# Altium project CH32V003J4M6_kit.PrjPCB
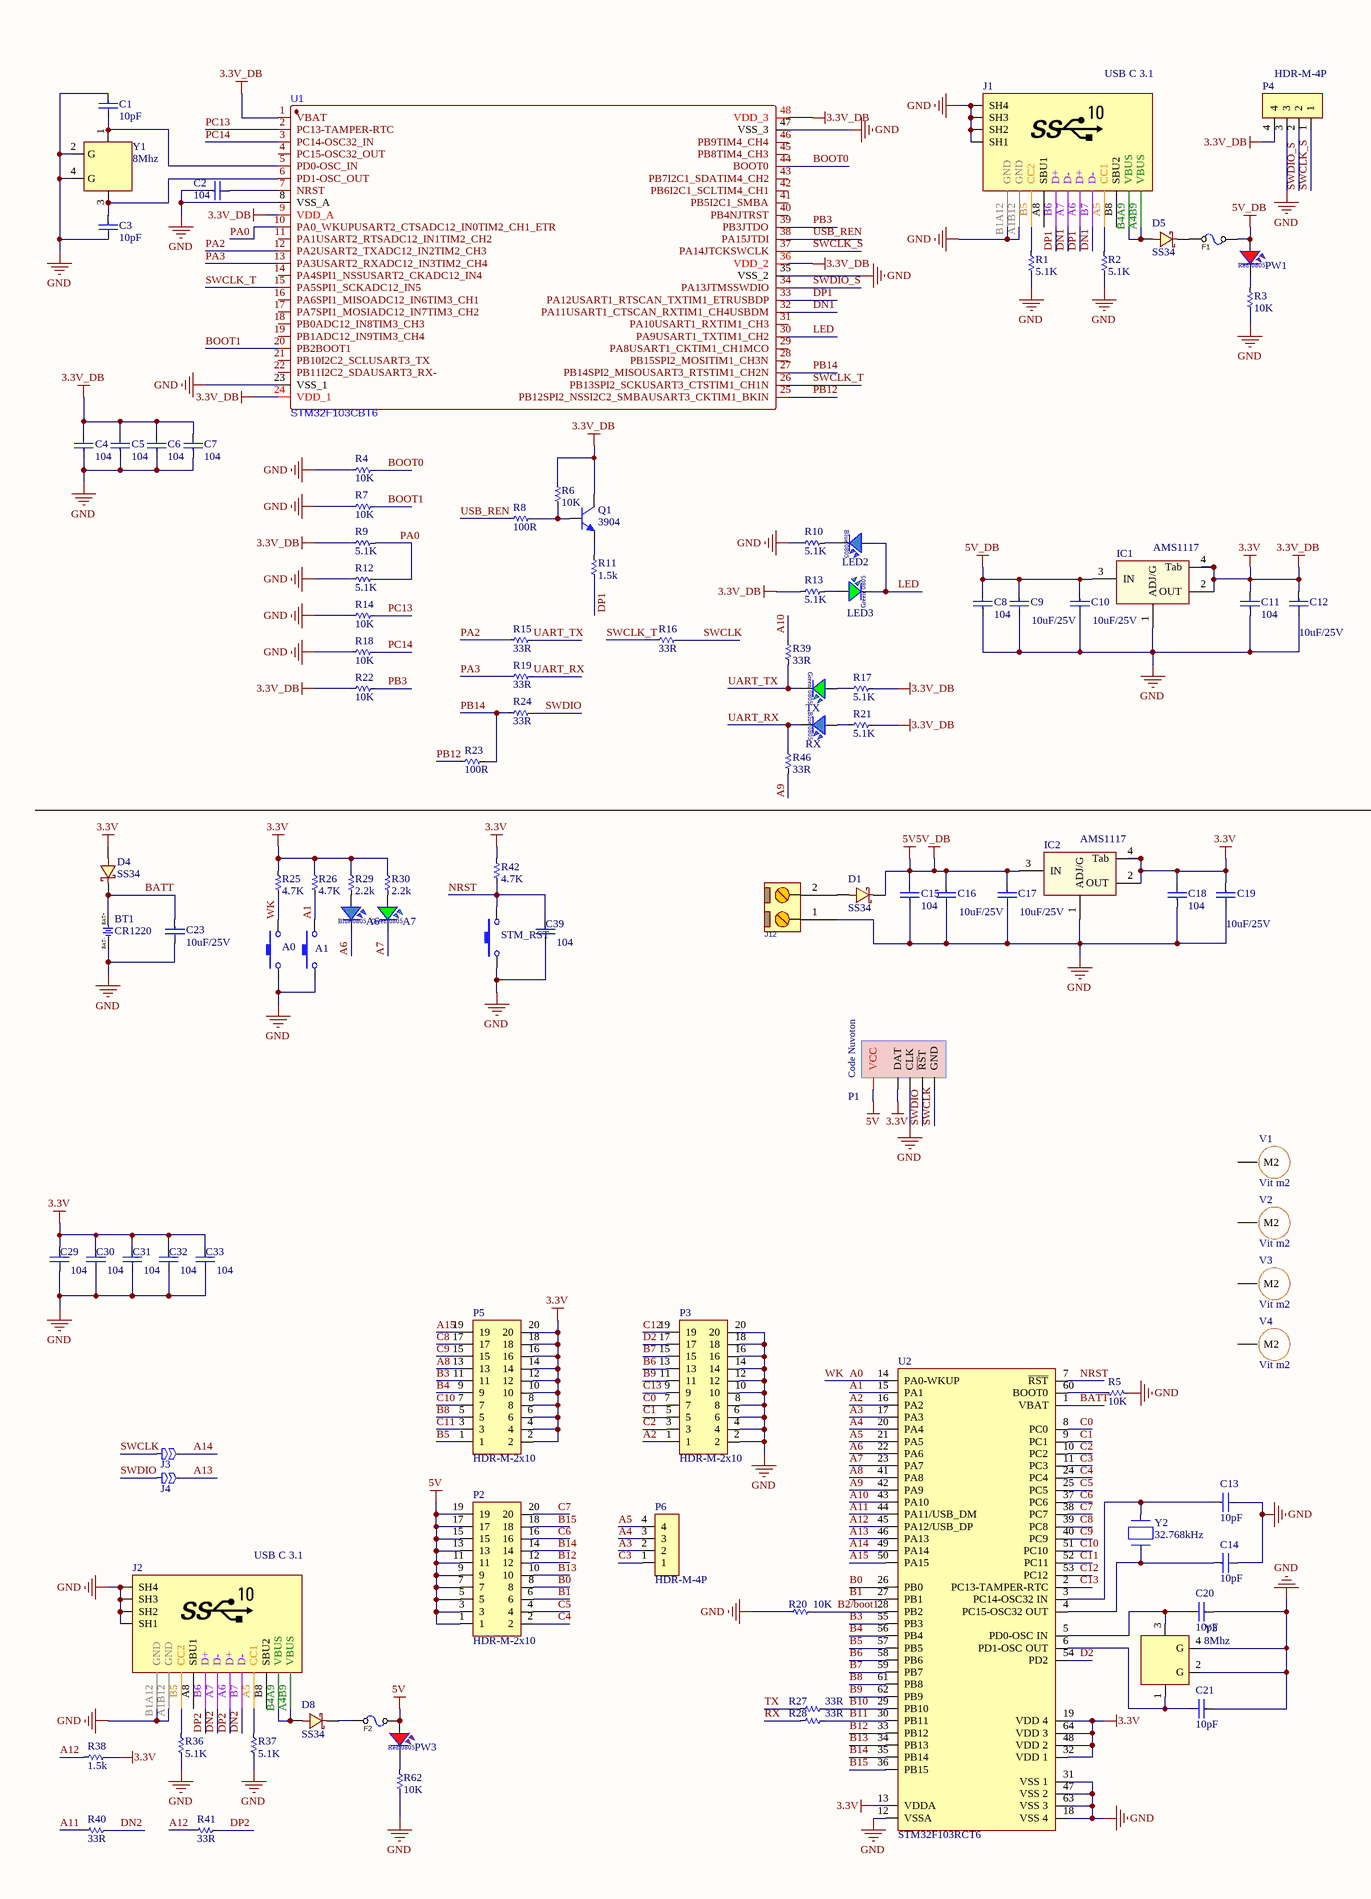
[diagram p0: CH32V003J4M6.SchDoc, left]
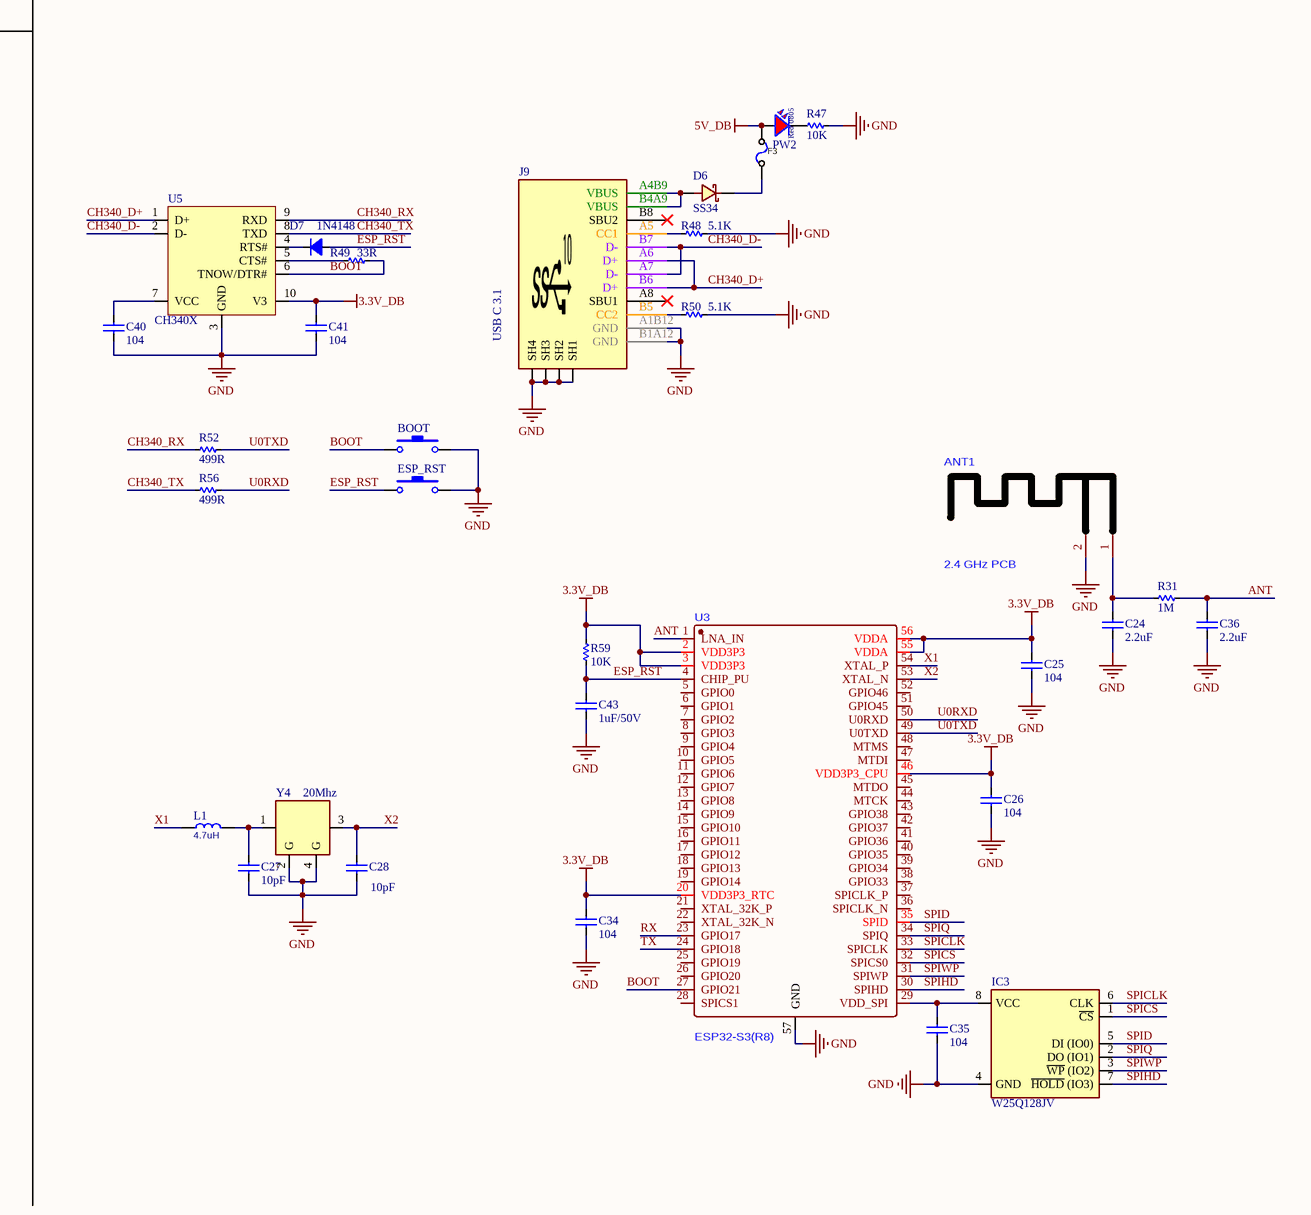
[diagram p1: CH32V003J4M6.SchDoc, right]
1 sheet, 140 parts. Net scope: global (net labels, ports and power ports of the same name join across sheets).
Board file: pcb.PcbDoc

## Sheet CH32V003J4M6.SchDoc: <Project Name>
size A2; ENG_APP_DATE: --/--/--; DSN_APP_DATE: --/--/--; CHK_APP_DATE: --/--/--; Engineer: Engineer; Address4: Thành phố Hồ Chí Minh; DocumentNumber: 1; Revision: 1.0; SheetNumber: 1; SheetTotal: 1

### Parts
A0  SW-SMD  [SW-SMD 3x6 mm]  (value not drawn)
A1  SW-SMD  [SW-SMD 3x6 mm]  (value not drawn)
A6  LED BLUE  [LED 0805 Blue]  (value not drawn)
A7  LED GREEN  [LED 0805 Green]  (value not drawn)
ANT1  2.4 GHz PCB  [2.4 GHZ PCB ANTENA]
BOOT  SW-SMD  [SW-SMD 3x6 mm]  (value not drawn)
BT1  CR1220  [BTH1220]  (no BOM)
C1  10pF  [C_0805_SMD]
C2  104  [C_0805_SMD]
C3  10pF  [C_0805_SMD]
C4  104  [C_0805_SMD]
C5  104  [C_0805_SMD]
C6  104  [C_0805_SMD]
C7  104  [C_0805_SMD]
C8  104  [C_0805_SMD]
C9  10uF/25V  [C_0805_SMD]
C10  10uF/25V  [C_0805_SMD]
C11  104  [C_0805_SMD]
C12  10uF/25V  [C_0805_SMD]
C13  10pF  [C_0805_SMD]
C14  10pF  [C_0805_SMD]
C15  104  [C_0805_SMD]
C16  10uF/25V  [C_0805_SMD]
C17  10uF/25V  [C_0805_SMD]
C18  104  [C_0805_SMD]
C19  10uF/25V  [C_0805_SMD]
C20  10pF  [C_0805_SMD]
C21  10pF  [C_0805_SMD]
C23  10uF/25V  [C_0805_SMD]
C24  2.2uF  [C_0603_SMD]
C25  104  [C_0805_SMD]
C26  104  [C_0805_SMD]
C27  10pF  [C_0805_SMD]
C28  10pF  [C_0805_SMD]
C29  104  [C_0805_SMD]
C30  104  [C_0805_SMD]
C31  104  [C_0805_SMD]
C32  104  [C_0805_SMD]
C33  104  [C_0805_SMD]
C34  104  [C_0805_SMD]
C35  104  [C_0805_SMD]
C36  2.2uF  [C_0603_SMD]
C39  104  [C_0805_SMD]
C40  104  [C_0805_SMD]
C41  104  [C_0805_SMD]
C43  1uF/50V  [C_0805_SMD]
D1  SS34  [D_SMA]
D4  SS34  [D_SMA]
D5  SS34  [D_SMA]
D6  SS34  [D_SMA]
D7  1N4148  [D_SOD323]
D8  SS34  [D_SMA]
ESP_RST  SW-SMD  [SW-SMD 3x6 mm]  (value not drawn)
F1  0805L050WR  [F0805]  (value not drawn)
F2  0805L050WR  [F0805]  (value not drawn)
F3  0805L050WR  [F0805]  (value not drawn)
IC1  AMS1117  [SOT223-4N]
IC2  AMS1117  [SOT223-4N]
IC3  W25Q128JV  [SO_8_W]
J1  USB C 3.1  [USBC_SMD_16_USB4105]
J2  USB C 3.1  [USBC_SMD_16_USB4105]
J3  Jump  [JP_0603]  (value not drawn)  (no BOM)
J4  Jump  [JP_0603]  (value not drawn)  (no BOM)
J9  USB C 3.1  [USBC_SMD_16_USB4105]
J12  KF3.81-2P  [CONN KF-3.81-2-R]  (value not drawn)
L1  4.7uH  [L 0805]
LED2  LED BLUE  [LED 0805 Blue]  (value not drawn)
LED3  LED GREEN  [LED 0805 Green]  (value not drawn)
P1  Nuvoton  [Header Code Nuvoton 2.54 6P]  (value not drawn)  (no BOM)
P2  HDR-M-2x10  [HDR_M_2X10]
P3  HDR-M-2x10  [HDR_M_2X10]
P4  HDR-M-4P  [HDR_M_1X4]
P5  HDR-M-2x10  [HDR_M_2X10]
P6  HDR-M-4P  [HDR_M_1X4]
PW1  LED RED  [LED 0805 Red]  (value not drawn)
PW2  LED RED  [LED 0805 Red]  (value not drawn)
PW3  LED RED  [LED 0805 Red]  (value not drawn)
Q1  3904  [SOT23_N NXP]
R1  5.1K  [RES-SMD-0805]
R2  5.1K  [RES-SMD-0805]
R3  10K  [RES-SMD-0805]
R4  10K  [RES-SMD-0805]
R5  10K  [RES-SMD-0805]
R6  10K  [RES-SMD-0805]
R7  10K  [RES-SMD-0805]
R8  100R  [RES-SMD-0805]
R9  5.1K  [RES-SMD-0805]
R10  5.1K  [RES-SMD-0805]
R11  1.5k  [RES-SMD-0805]
R12  5.1K  [RES-SMD-0805]
R13  5.1K  [RES-SMD-0805]
R14  10K  [RES-SMD-0805]
R15  33R  [RES-SMD-0805]
R16  33R  [RES-SMD-0805]
R17  5.1K  [RES-SMD-0805]
R18  10K  [RES-SMD-0805]
R19  33R  [RES-SMD-0805]
R20  10K  [RES-SMD-0805]
R21  5.1K  [RES-SMD-0805]
R22  10K  [RES-SMD-0805]
R23  100R  [RES-SMD-0805]
R24  33R  [RES-SMD-0805]
R25  4.7K  [RES-SMD-0805]
R26  4.7K  [RES-SMD-0805]
R27  33R  [RES-SMD-0805]
R28  33R  [RES-SMD-0805]
R29  2.2k  [RES-SMD-0805]
R30  2.2k  [RES-SMD-0805]
R31  1M  [RES-SMD-0603]
R36  5.1K  [RES-SMD-0805]
R37  5.1K  [RES-SMD-0805]
R38  1.5k  [RES-SMD-0805]
R39  33R  [RES-SMD-0805]
R40  33R  [RES-SMD-0805]
R41  33R  [RES-SMD-0805]
R42  4.7K  [RES-SMD-0805]
R46  33R  [RES-SMD-0805]
R47  10K  [RES-SMD-0805]
R48  5.1K  [RES-SMD-0805]
R49  33R  [RES-SMD-0805]
R50  5.1K  [RES-SMD-0805]
R52  499R  [RES-SMD-0805]
R56  499R  [RES-SMD-0805]
R59  10K  [RES-SMD-0805]
R62  10K  [RES-SMD-0805]
RX  LED BLUE  [LED 0805 Blue]  (value not drawn)
STM_RST  SW-SMD  [SW-SMD 3x6 mm]  (value not drawn)
TX  LED GREEN  [LED 0805 Green]  (value not drawn)
U1  STM32F103CBT6  [LQFP-48_L7.0-W7.0-P0.50-LS9.0-BL]
U2  STM32F103RCT6  [QFG50_64]
U3  ESP32-S3(R8)  [QFN-56_L7.0-W7.0-P0.40-TL-EP4.0]
U5  CH340X  [VSSOP-10]
V1  Vit m2  [Screw 2mm - VIA]  (no BOM)
V2  Vit m2  [Screw 2mm - VIA]  (no BOM)
V3  Vit m2  [Screw 2mm - VIA]  (no BOM)
V4  Vit m2  [Screw 2mm - VIA]  (no BOM)
Y1  8Mhz  [XTL_4_5032]
Y2  32.768kHz  [XTLT_RTC]
Y3  8Mhz  [XTL_4_5032]
Y4  20Mhz  [XTL_4_5032]

### Nets
3.3V: C4.1 C5.1 C6.1 C7.1 C11.1 C12.2 C18.1 C19.2 C25.2 C26.2 C29.2 C30.2 C31.2 C32.2 C33.2 C34.2 C41.2 D4.1(A) IC1.2(OUT) IC1.4(Tab) IC2.2(OUT) IC2.4(Tab) P1.3(DAT) P4.4 P5.2 P5.4 P5.6 P5.8 P5.10 P5.12 P5.14 P5.16 P5.18 P5.20 Q1.3(C) R6.1 R9.2 R13.2 R17.1 R21.1 R22.2 R25.1 R26.1 R29.1 R30.1 R38.1 R42.1 R59.2 U1.1(VBAT) U1.9(VDD_A) U1.24(VDD_1) U1.36(VDD_2) U1.48(VDD_3) U2.13(VDDA) U2.19(VDD_4) U2.32(VDD_1) U2.48(VDD_2) U2.64(VDD_3) U3.2(VDD3P3) U3.3(VDD3P3) U3.20(VDD3P3_RTC) U3.46(VDD3P3_CPU) U3.55(VDDA) U3.56(VDDA) U5.10(V3)  [also labelled 3.3V_DB]
5V: C8.1 C9.2 C10.2 C15.1 C16.2 C17.2 D1.2(K) F1.2 F2.2 F3.2 IC1.3(IN) IC2.3(IN) P1.1(VCC) P2.1 P2.3 P2.5 P2.7 P2.9 P2.11 P2.13 P2.15 P2.17 P2.19 PW1.1 PW2.1 PW3.1  [also labelled 5V_DB]
GND: A0.1 A1.1 ANT1.2 BOOT.2 BT1.2 C1.2 C2.2 C3.1 C4.2 C5.2 C6.2 C7.2 C8.2 C9.1 C10.1 C11.2 C12.1 C13.1 C14.1 C15.2 C16.1 C17.1 C18.2 C19.1 C20.2 C21.2 C23.1 C24.1 C25.1 C26.1 C27.2 C28.2 C29.1 C30.1 C31.1 C32.1 C33.1 C34.1 C35.1 C36.1 C39.1 C40.1 C41.1 C43.1 ESP_RST.2 IC1.1(ADJ/G) IC2.1(ADJ/G) IC3.4(GND) J1.A1B12(GND) J1.B1A12(GND) J1.SH1 J1.SH2 J1.SH3 J1.SH4 J2.A1B12(GND) J2.B1A12(GND) J2.SH1 J2.SH2 J2.SH3 J2.SH4 J9.A1B12(GND) J9.B1A12(GND) J9.SH1 J9.SH2 J9.SH3 J9.SH4 J12.1 P1.4(CLK) P3.2 P3.4 P3.6 P3.8 P3.10 P3.12 P3.14 P3.16 P3.18 P3.20 P4.3 R1.2 R2.2 R3.2 R4.2 R5.2 R7.2 R10.2 R12.2 R14.2 R18.2 R20.2 R36.2 R37.2 R47.2 R48.1 R50.1 R62.2 STM_RST.1 U1.8(VSS_A) U1.23(VSS_1) U1.35(VSS_2) U1.47(VSS_3) U2.12(VSSA) U2.18(VSS_4) U2.31(VSS_1) U2.47(VSS_2) U2.63(VSS_3) U3.57(GND) U5.3(GND) Y1.2(G) Y1.4(G) Y3.2(G) Y3.4(G) Y4.2(G) Y4.4(G)
A0: A0.2 R25.2 U2.14(PA0-WKUP)  [also labelled WK]
A1: A1.2 R26.2 U2.15(PA1)
A2: P3.1 U2.16(PA2)
A3: P6.2 U2.17(PA3)
A4: P6.3 U2.20(PA4)
A5: P6.4 U2.21(PA5)
A6: A6.2 U2.22(PA6)
A7: A7.2 U2.23(PA7)
A8: P5.13 U2.41(PA8)
A9: R46.2 U2.42(PA9)
A10: R39.1 U2.43(PA10)
A11: R40.1 U2.44(PA11/USB_DM)
A12: R38.2 R41.1 U2.45(PA12/USB_DP)
A13: J4.2 U2.46(PA13)
A14: J3.2 U2.49(PA14)
A15: P5.19 U2.50(PA15)
ANT: C36.2 R31.1 U3.1(LNA_IN)
B0: P2.8 U2.26(PB0)
B1: P2.6 U2.27(PB1)
B2/boot1: R20.1 U2.28(PB2)
B3: P5.11 U2.55(PB3)
B4: P5.9 U2.56(PB4)
B5: P5.1 U2.57(PB5)
B6: P3.13 U2.58(PB6)
B7: P3.15 U2.59(PB7)
B8: P5.5 U2.61(PB8)
B9: P3.11 U2.62(PB9)
B10: R27.2 U2.29(PB10)
B11: R28.2 U2.30(PB11)
B12: P2.12 U2.33(PB12)
B13: P2.10 U2.34(PB13)
B14: P2.14 U2.35(PB14)
B15: P2.18 U2.36(PB15)
BATT: BT1.1(BAT+) C23.2 D4.2(K) U2.1(VBAT)
BOOT: BOOT.1 R49.1 U3.27(GPIO21) U5.6(TNOW/DTR#)
BOOT0: R4.1 U1.44(BOOT0)
BOOT1: R7.1 U1.20(PB2BOOT1)
C0: P3.7 U2.8(PC0)
C1: P3.5 U2.9(PC1)
C2: P3.3 U2.10(PC2)
C3: P6.1 U2.11(PC3)
C4: P2.2 U2.24(PC4)
C5: P2.4 U2.25(PC5)
C6: P2.16 U2.37(PC6)
C7: P2.20 U2.38(PC7)
C8: P5.17 U2.39(PC8)
C9: P5.15 U2.40(PC9)
C10: P5.7 U2.51(PC10)
C11: P5.3 U2.52(PC11)
C12: P3.19 U2.53(PC12)
C13: P3.9 U2.2(PC13-TAMPER-RTC)
CH340_D+: J9.A6(D+) J9.B6(D+) U5.1(D+)
CH340_D-: J9.A7(D-) J9.B7(D-) U5.2(D-)
CH340_RX: R52.2 U5.9(RXD)
CH340_TX: R56.2 U5.8(TXD)
D2: P3.17 U2.54(PD2)
DN1: J1.A7(D-) J1.B7(D-) U1.32(PA11USART1_CTSCAN_RXTIM1_CH4USBDM)
DN2: J2.A7(D-) J2.B7(D-) R40.2
DP1: J1.A6(D+) J1.B6(D+) R11.2 U1.33(PA12USART1_RTSCAN_TXTIM1_ETRUSBDP)
DP2: J2.A6(D+) J2.B6(D+) R41.2
ESP_RST: C43.2 D7.1 ESP_RST.1 R59.1 U3.4(CHIP_PU)
LED: LED2.1 LED3.2 U1.30(PA9USART1_TXTIM1_CH2)
NRST: C39.2 R42.2 STM_RST.2 U2.7(~{RST})
PA0: R9.1 R12.1 U1.10(PA0_WKUPUSART2_CTSADC12_IN0TIM2_CH1_ETR)
PA2: R15.2 U1.12(PA2USART2_TXADC12_IN2TIM2_CH3)
PA3: R19.2 U1.13(PA3USART2_RXADC12_IN3TIM2_CH4)
PB3: R22.1 U1.39(PB3JTDO)
PB12: R23.2 U1.25(PB12SPI2_NSSI2C2_SMBAUSART3_CKTIM1_BKIN)
PB14: R23.1 R24.2 U1.27(PB14SPI2_MISOUSART3_RTSTIM1_CH2N)
PC13: R14.1 U1.2(PC13-TAMPER-RTC)
PC14: R18.1 U1.3(PC14-OSC32_IN)
RX: R28.1 U3.23(GPIO17)
SPICLK: IC3.6(CLK) U3.33(SPICLK)
SPICS: IC3.1(~{CS}) U3.32(SPICS0)
SPID: IC3.5(DI_(IO0)) U3.35(SPID)
SPIHD: IC3.7(~{HOLD}_(IO3)) U3.30(SPIHD)
SPIQ: IC3.2(DO_(IO1)) U3.34(SPIQ)
SPIWP: IC3.3(~{WP}_(IO2)) U3.31(SPIWP)
SWCLK: J3.1 P1.6(GND) R16.1
SWCLK_S: P4.1 U1.37(PA14JTCKSWCLK)
SWCLK_T: R16.2 U1.15(PA5SPI1_SCKADC12_IN5) U1.26(PB13SPI2_SCKUSART3_CTSTIM1_CH1N)
SWDIO: J4.1 P1.5(~{RS}T) R24.1
SWDIO_S: P4.2 U1.34(PA13JTMSSWDIO)
TX: R27.1 U3.24(GPIO18)
U0RXD: R56.1 U3.50(U0RXD)
U0TXD: R52.1 U3.49(U0TXD)
UART_RX: R19.1 R46.1 RX.2
UART_TX: R15.1 R39.2 TX.2
USB_REN: R8.2 U1.38(PA15JTDI)
X1: L1.1 U3.54(XTAL_P)
X2: C28.1 U3.53(XTAL_N) Y4.3(O)
NetA6_1: A6.1 R29.2
NetA7_1: A7.1 R30.2
NetANT1_1: ANT1.1 C24.2 R31.2
NetC1_1: C1.1 U1.5(PD0-OSC_IN) Y1.1(I)
NetC2_1: C2.1 U1.7(NRST)
NetC3_2: C3.2 U1.6(PD1-OSC_OUT) Y1.3(O)
NetC13_2: C13.2 U2.3(PC14-OSC32_IN) Y2.2
NetC14_2: C14.2 U2.4(PC15-OSC32_OUT) Y2.1
NetC20_1: C20.1 U2.5(PD0-OSC_IN) Y3.3(O)
NetC21_1: C21.1 U2.6(PD1-OSC_OUT) Y3.1(I)
NetC27_1: C27.1 L1.2 Y4.1(I)
NetC35_2: C35.2 IC3.8(VCC) U3.29(VDD_SPI)
NetC40_2: C40.2 U5.7(VCC)
NetD1_1: D1.1(A) J12.2
NetD5_1: D5.1(A) J1.A4B9(VBUS) J1.B4A9(VBUS)
NetD5_2: D5.2(K) F1.1
NetD6_1: D6.1(A) J9.A4B9(VBUS) J9.B4A9(VBUS)
NetD6_2: D6.2(K) F3.1
NetD7_2: D7.2 U5.4(RTS#)
NetD8_1: D8.1(A) J2.A4B9(VBUS) J2.B4A9(VBUS)
NetD8_2: D8.2(K) F2.1
NetJ1_A5: J1.A5(CC1) R2.1
NetJ1_B5: J1.B5(CC2) R1.1
NetJ2_A5: J2.A5(CC1) R37.1
NetJ2_B5: J2.B5(CC2) R36.1
NetJ9_A5: J9.A5(CC1) R48.2
NetJ9_B5: J9.B5(CC2) R50.2
NetLED2_2: LED2.2 R10.1
NetLED3_1: LED3.1 R13.1
NetPW1_2: PW1.2 R3.1
NetPW2_2: PW2.2 R47.1
NetPW3_2: PW3.2 R62.1
NetQ1_1: Q1.1(B) R6.2 R8.1
NetQ1_2: Q1.2(E) R11.1
NetR5_1: R5.1 U2.60(BOOT0)
NetR17_2: R17.2 TX.1
NetR21_2: R21.2 RX.1
NetR49_2: R49.2 U5.5(CTS#)

Not connected (* = marked no-connect by the designer): J1 A8(SBU1) B8(SBU2); J2 A8(SBU1) B8(SBU2); J9 A8(SBU1)* B8(SBU2)*; U1 4(PC15-OSC32_OUT) 11(PA1USART2_RTSADC12_IN1TIM2_CH2) 14(PA4SPI1_NSSUSART2_CKADC12_IN4) 16(PA6SPI1_MISOADC12_IN6TIM3_CH1) 17(PA7SPI1_MOSIADC12_IN7TIM3_CH2) 18(PB0ADC12_IN8TIM3_CH3) 19(PB1ADC12_IN9TIM3_CH4) 21(PB10I2C2_SCLUSART3_TX) 22(PB11I2C2_SDAUSART3_RX-) 28(PB15SPI2_MOSITIM1_CH3N) 29(PA8USART1_CKTIM1_CH1MCO) 31(PA10USART1_RXTIM1_CH3) 40(PB4NJTRST) 41(PB5I2C1_SMBA) 42(PB6I2C1_SCLTIM4_CH1) 43(PB7I2C1_SDATIM4_CH2) 45(PB8TIM4_CH3) 46(PB9TIM4_CH4); U3 5(GPIO0) 6(GPIO1) 7(GPIO2) 8(GPIO3) 9(GPIO4) 10(GPIO5) 11(GPIO6) 12(GPIO7) 13(GPIO8) 14(GPIO9) 15(GPIO10) 16(GPIO11) 17(GPIO12) 18(GPIO13) 19(GPIO14) 21(XTAL_32K_P) 22(XTAL_32K_N) 25(GPIO19) 26(GPIO20) 28(SPICS1) 36(SPICLK_N) 37(SPICLK_P) 38(GPIO33) 39(GPIO34) 40(GPIO35) 41(GPIO36) 42(GPIO37) 43(GPIO38) 44(MTCK) 45(MTDO) 47(MTDI) 48(MTMS) 51(GPIO45) 52(GPIO46); V1 1(M2); V2 1(M2); V3 1(M2); V4 1(M2)

### Notes on the sheet
- Title
- Size:
- Date:
- A4
- Number:
- Time:
- Revision:
- Sheet
- of
- File:
- (in symbol BATH_CR1220) BAT-
- (in symbol Header Code Nuvoton) Code Nuvoton
- (in symbol LED 0805 BLUE) Blue; 0805
- (in symbol LED 0805 GREEN) 0805; Green
- (in symbol LED 0805 RED) Red; 0805

### Library data of the parts
A0 A1 BOOT ESP_RST STM_RST = SW2 SMD 3x6: Button 3x6 mm x 2.5mm 2Pin SMD; Code: 3606-006
A6 LED2 RX = LED 0805 BLUE: LED 0805 SMD BLUE; Code: 8600-019; Designed by: TranLuyen
A7 LED3 TX = LED 0805 GREEN: LED 0805 SMD GREEN; Code: 8600-027; Designed by: TranLuyen
BT1 = BATH_CR1220: BATTERY HOLDER, CR1220 SMD; Code: 11008-012; Designed by: TranLuyen; Code_sub1: 10101-015; Value: CR1220; ComponentLink1Description: Links; ComponentLink1URL: https://dientutuonglai.com/san-pham/?keyword=11008-012&group_product=
C1 C3 C13 C14 C20 C21 C27 C28 = Cap 0805 10pF 50V: Cap SMD 0805; Code: 1438-018
C2 C4-C8 C11 C15 C18 C25 C26 C29-C35 C39-C41 = Cap 0805 104 100nF: Cap SMD 0805 104-100nF-0.1uF 50V; Code: 1438-080
C9 C10 C12 C16 C17 C19 C23 = Cap 0805 10uF 25V: Cap SMD 0805 10uF; Code: 1436-100
C24 C36 = Cap 0603 2.2uF 50V: Cap SMD 0603; Code: 1451-094
C43 = Cap 0805 1uF 50V: Cap SMD 0805 105 - 1uF 50V; Code: 1438-092
D1 D4-D6 D8 = SS34-SMA: Surface-Mount Schottky Barrier Rectifier; Code: 2005-008
D7 = 1N4148WS - T4 SOD-323: T4-Rectifier Diode Small Signal Switching 100V 0.25A 4ns 2-Pin SOD-323; Code: 2001-025
F1-F3 = FUSE 0805 500mA: 0805L050WR 0805 6V 500mA; Code: N/A
IC1 IC2 = AMS1117-3.3V SOT223: SOT-223; Code: 5102-034
IC3 = W25Q128JV SOIC 8 W: W25Q128JVSSIQ IC Flash 128MBIT; Code: 5015-093
J1 = CONN_USBC_SMD_16_USB4105: CONN, USB, Type C, USB 2.0, Right-Angle, SMD; Rule: UNIONINDEX=0|RULEKIND=Clearance|NETSCOPE=DifferentNets|LAYERKIND=SameLayer|NAME=Schematic Clearance Constraint|GAP=10mil|GENERICCLEARANCE=10mil|IGNOREPADTOPADCLEARANCEINFOOTPRINT=TRUE|OBJECTCLEARANCES=ClearanceObj_Arc-ClearanceObj_Arc:50000;ClearanceObj_Arc-ClearanceObj_Track:50000;ClearanceObj_Arc-ClearanceObj_SMDPad:50000;ClearanceObj_Arc-ClearanceObj_THPad:50000;ClearanceObj_Arc-ClearanceObj_Hole:0;ClearanceObj_Track-ClearanceObj_Track:50000;ClearanceObj_Track-ClearanceObj_SMDPad:50000;ClearanceObj_Track-ClearanceObj_THPad:50000;ClearanceObj_Track-ClearanceObj_Hole:0;ClearanceObj_SMDPad-ClearanceObj_SMDPad:50000;ClearanceObj_SMDPad-ClearanceObj_THPad:50000;ClearanceObj_SMDPad-ClearanceObj_Fill:50000;ClearanceObj_SMDPad-ClearanceObj_Poly:50000;ClearanceObj_SMDPad-ClearanceObj_Region:50000;ClearanceObj_SMDPad-ClearanceObj_Hole:0;ClearanceObj_THPad-ClearanceObj_Hole:0;ClearanceObj_Via-ClearanceObj_Hole:0;ClearanceObj_Fill-ClearanceObj_Hole:0;ClearanceObj_Poly-ClearanceObj_Hole:0;ClearanceObj_Region-ClearanceObj_Hole:0;ClearanceObj_Text-ClearanceObj_Hole:0|UNIT=Imperial
J2 J9 = CONN_USBC_SMD_16_USB4105: CONN, USB, Type C, USB 2.0, Right-Angle, SMD; Code: 3518-006; Rule: UNIONINDEX=0|RULEKIND=Clearance|NETSCOPE=DifferentNets|LAYERKIND=SameLayer|NAME=Schematic Clearance Constraint|GAP=10mil|GENERICCLEARANCE=10mil|IGNOREPADTOPADCLEARANCEINFOOTPRINT=TRUE|OBJECTCLEARANCES=ClearanceObj_Arc-ClearanceObj_Arc:50000;ClearanceObj_Arc-ClearanceObj_Track:50000;ClearanceObj_Arc-ClearanceObj_SMDPad:50000;ClearanceObj_Arc-ClearanceObj_THPad:50000;ClearanceObj_Arc-ClearanceObj_Hole:0;ClearanceObj_Track-ClearanceObj_Track:50000;ClearanceObj_Track-ClearanceObj_SMDPad:50000;ClearanceObj_Track-ClearanceObj_THPad:50000;ClearanceObj_Track-ClearanceObj_Hole:0;ClearanceObj_SMDPad-ClearanceObj_SMDPad:50000;ClearanceObj_SMDPad-ClearanceObj_THPad:50000;ClearanceObj_SMDPad-ClearanceObj_Fill:50000;ClearanceObj_SMDPad-ClearanceObj_Poly:50000;ClearanceObj_SMDPad-ClearanceObj_Region:50000;ClearanceObj_SMDPad-ClearanceObj_Hole:0;ClearanceObj_THPad-ClearanceObj_Hole:0;ClearanceObj_Via-ClearanceObj_Hole:0;ClearanceObj_Fill-ClearanceObj_Hole:0;ClearanceObj_Poly-ClearanceObj_Hole:0;ClearanceObj_Region-ClearanceObj_Hole:0;ClearanceObj_Text-ClearanceObj_Hole:0|UNIT=Imperial
J3 J4 = Jump 2 SMD: Jumper, SMD; Rule: UNIONINDEX=0|RULEKIND=Clearance|NETSCOPE=DifferentNets|LAYERKIND=SameLayer|NAME=Schematic Clearance Constraint|GAP=10mil|GENERICCLEARANCE=10mil|IGNOREPADTOPADCLEARANCEINFOOTPRINT=FALSE|OBJECTCLEARANCES=ClearanceObj_Arc-ClearanceObj_Hole:0;ClearanceObj_Track-ClearanceObj_Hole:0;ClearanceObj_SMDPad-ClearanceObj_Hole:0;ClearanceObj_THPad-ClearanceObj_Hole:0;ClearanceObj_Via-ClearanceObj_Hole:0;ClearanceObj_Fill-ClearanceObj_Hole:0;ClearanceObj_Poly-ClearanceObj_Hole:0;ClearanceObj_Region-ClearanceObj_Region:50000;ClearanceObj_Region-ClearanceObj_Hole:0;ClearanceObj_Text-ClearanceObj_Hole:0|UNIT=Imperial
J12 = CONN KF 3.81 2P: KF-3.81-2-R Terminal Block Plug-in 3.81mm 2pin chan cong; Code: N/A
L1 = Inductor 0805 4.7uH 30mA: 4.7uH 0805 30mA; Code: 1511-036; VALUE: 4.7uH
P1 = Header Code Nuvoton: Header 6-5Pin
P2 P3 P5 = HDRM 2x10 2.54: HDR 2.54 MALE; Code: 3504-027 * 0.25pcs
P4 P6 = HDR 2.54 M 4 Pin: HDR 2.54 MALE; Code: 3504-028 * 0.1
PW1-PW3 = LED 0805 RED: LED 0805 SMD RED; Code: 8600-017; Designed by: TranLuyen
Q1 = MMBT3904: Vce max: 40V, Ic max: 0.2A, P: 0.3W; Code: 1701-065; Designed by: nhox
R1 R2 R9 R10 R12 R13 R17 R21 R36 R37 R48 R50 = Res 5.1k 0805: Resistor SMD 0805; Code: 1024-104
R3-R7 R14 R18 R20 R22 R47 R59 R62 = Res 10k 0805: Resistor SMD 0805; Code: 1024-111
R8 R23 = Res 100R 0805: Resistor SMD 0805; Code: 1025-063
R11 R38 = Res 1.5K 0805: Resistor SMD 0805; Code: 1024-090; Value: 1.5k
R15 R16 R19 R24 R27 R28 R39-R41 R46 R49 = Res 33R 0805: Resistor SMD 0805; Code: N/A
R25 R26 R42 = Res 4.7k 0805: Resistor SMD 0805; Code: 1024-103
R29 R30 = Res 2.2K 0805: Resistor SMD 0805; Code: 1024-094
R31 = Res 1M 0603: Resistor SMD 0603; Code: 1028-162
R52 R56 = Res 0805 300R: Resistor SMD 0805
U2 = STM32103FRCT6: STM32F103RCT6, LQFP64; Code: 7203-028; Designed by: Nhox
U5 = CH340X MSOP-10: USB to Serial Port Chip CH340; Designed by: TranLuyen; Code: N/A
V1-V4 = Screw Vit m2: Screw Vit 2mm; Code: N/A
Y1 Y3 = OSC_4_8MHz_5032: CLOCK OSCILLATOR, Crystal 5032 5 x 3.2 x 0.8mm; Code: 2506-033; Designed by: TranLuyen
Y2 = Crystal 32.768kHz 2x6mm: 32.768kHz ±20ppm D: 2.0mm x L: 6.0 mm; Code: 2503-006
Y4 = OSC_4_20MHz_5032: CLOCK OSCILLATOR, Crystal 5032 5 x 3.2 x 0.8mm; Code: 2506-022; Designed by: TranLuyen

## Assembly variants
giacong: all parts fitted